# Altium schematic sheet STM32.SchDoc
size A4; SheetNumber: 8; SheetTotal: 9
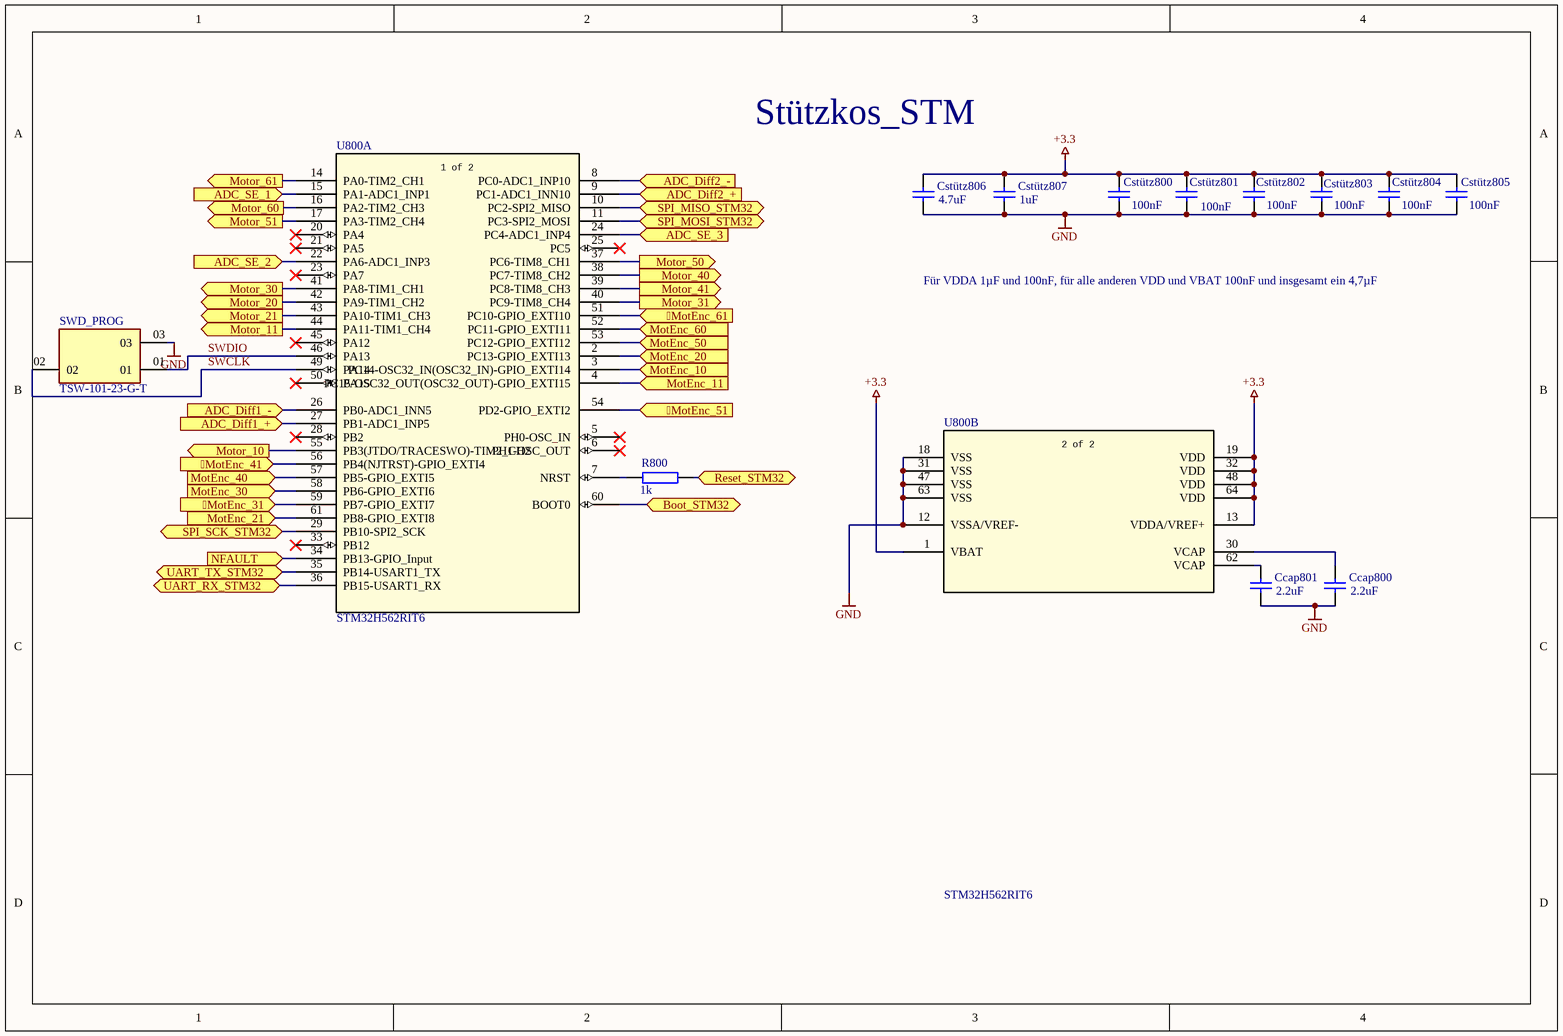
[diagram p0: STM32.SchDoc]

## Parts
Ccap800  value 2.2uF  [0603]  (hidden comment: 0603)
Ccap801  value 2.2uF  [0603]  (hidden comment: 0603)
Cstütz800  value 100nF  [0603]  (hidden comment: 0603)
Cstütz801  value 100nF  [0603]  (hidden comment: 0603)
Cstütz802  value 100nF  [0603]  (hidden comment: 0603)
Cstütz803  value 100nF  [0603]  (hidden comment: 0603)
Cstütz804  value 100nF  [0603]  (hidden comment: 0603)
Cstütz805  value 100nF  [0603]  (hidden comment: 0603)
Cstütz806  value 4.7uF  [0603]  (hidden comment: 0603)
Cstütz807  value 1uF  [0603]  (hidden comment: 0603)
R800  value 1k  [0603]  (hidden comment: 0603)
SWD_PROG  TSW-101-23-G-T  [SAMTEC_TSW-101-23-G-T]
U800  STM32H562RIT6  [LQFP64-10x10mm_STM]  (parts A,B of 2)

## Ports
MotEnc_31 (in, see DRV+Motor[3D]), MotEnc_41 (in, see DRV+Motor[3B]), MotEnc_51 (in, see DRV+Motor[3C]), MotEnc_61 (in, see DRV+Motor[3D]), ADC_Diff1_+ (in, see Test_Sensor_Connectoren[1A]), ADC_Diff1_- (in, see Test_Sensor_Connectoren[1A]), ADC_Diff2_+ (in, see Test_Sensor_Connectoren[1B]), ADC_Diff2_- (in, see Test_Sensor_Connectoren[1B]), ADC_SE_1 (in, see Test_Sensor_Connectoren[1C]), ADC_SE_2 (in, see Test_Sensor_Connectoren[1C]), ADC_SE_3 (in, see Test_Sensor_Connectoren[1D]), Boot_STM32 (bidir, see Raspberry_PI5[3B]), MotEnc_10 (in, see DRV+Motor[2B]), MotEnc_11 (in, see DRV+Motor[3B]), MotEnc_20 (in, see DRV+Motor[2C]), MotEnc_21 (in, see DRV+Motor[3C]), MotEnc_30 (in, see DRV+Motor[2D]), MotEnc_40 (in, see DRV+Motor[3B]), MotEnc_50 (in, see DRV+Motor[3C]), MotEnc_60 (in, see DRV+Motor[3D]), Motor_10 (out, see DRV+Motor[1A]), Motor_11 (out, see DRV+Motor[1A]), Motor_20 (out, see DRV+Motor[1A]), Motor_21 (out, see DRV+Motor[1A]), Motor_30 (out, see DRV+Motor[1B]), Motor_31 (out, see DRV+Motor[1B]), Motor_40 (out, see DRV+Motor[1C]), Motor_41 (out, see DRV+Motor[1C]), Motor_50 (out, see DRV+Motor[1D]), Motor_51 (out, see DRV+Motor[1D]), Motor_60 (out, see DRV+Motor[1D]), Motor_61 (out, see DRV+Motor[1D]), NFAULT (in, see DRV+Motor[2A], DRV+Motor[2B], DRV+Motor[2D], DRV+Motor[4A]), Reset_STM32 (bidir, see Raspberry_PI5[3B]), SPI_MISO_STM32 (bidir, see Raspberry_PI5[2B]), SPI_MOSI_STM32 (bidir, see Raspberry_PI5[2B]), SPI_SCK_STM32 (bidir, see Raspberry_PI5[2B]), UART_RX_STM32 (bidir, see Raspberry_PI5[3B]), UART_TX_STM32 (bidir, see Raspberry_PI5[3B])

## Nets
+3.3: Cstütz800.2 Cstütz801.2 Cstütz802.2 Cstütz803.2 Cstütz804.2 Cstütz805.2 Cstütz806.2 Cstütz807.2 U800.1(VBAT) U800.13(VDDA/VREF+) U800.19(VDD) U800.32(VDD) U800.48(VDD) U800.64(VDD)
GND: Ccap800.1 Ccap801.1 Cstütz800.1 Cstütz801.1 Cstütz802.1 Cstütz803.1 Cstütz804.1 Cstütz805.1 Cstütz806.1 Cstütz807.1 SWD_PROG.03 U800.12(VSSA/VREF-) U800.18(VSS) U800.31(VSS) U800.47(VSS) U800.63(VSS)
MotEnc_31: U800.59(PB7-GPIO_EXTI7) ; port MotEnc_31
MotEnc_41: U800.56(PB4(NJTRST)-GPIO_EXTI4) ; port MotEnc_41
MotEnc_51: U800.54(PD2-GPIO_EXTI2) ; port MotEnc_51
MotEnc_61: U800.51(PC10-GPIO_EXTI10) ; port MotEnc_61
ADC_Diff1_+: U800.27(PB1-ADC1_INP5) ; port ADC_Diff1_+
ADC_Diff1_-: U800.26(PB0-ADC1_INN5) ; port ADC_Diff1_-
ADC_Diff2_+: U800.9(PC1-ADC1_INN10) ; port ADC_Diff2_+
ADC_Diff2_-: U800.8(PC0-ADC1_INP10) ; port ADC_Diff2_-
ADC_SE_1: U800.15(PA1-ADC1_INP1) ; port ADC_SE_1
ADC_SE_2: U800.22(PA6-ADC1_INP3) ; port ADC_SE_2
ADC_SE_3: U800.24(PC4-ADC1_INP4) ; port ADC_SE_3
Boot_STM32: U800.60(BOOT0) ; port Boot_STM32
MotEnc_10: U800.3(PC14-OSC32_IN(OSC32_IN)-GPIO_EXTI14) ; port MotEnc_10
MotEnc_11: U800.4(PC15-OSC32_OUT(OSC32_OUT)-GPIO_EXTI15) ; port MotEnc_11
MotEnc_20: U800.2(PC13-GPIO_EXTI13) ; port MotEnc_20
MotEnc_21: U800.61(PB8-GPIO_EXTI8) ; port MotEnc_21
MotEnc_30: U800.58(PB6-GPIO_EXTI6) ; port MotEnc_30
MotEnc_40: U800.57(PB5-GPIO_EXTI5) ; port MotEnc_40
MotEnc_50: U800.53(PC12-GPIO_EXTI12) ; port MotEnc_50
MotEnc_60: U800.52(PC11-GPIO_EXTI11) ; port MotEnc_60
Motor_10: U800.55(PB3(JTDO/TRACESWO)-TIM2_CH2) ; port Motor_10
Motor_11: U800.44(PA11-TIM1_CH4) ; port Motor_11
Motor_20: U800.42(PA9-TIM1_CH2) ; port Motor_20
Motor_21: U800.43(PA10-TIM1_CH3) ; port Motor_21
Motor_30: U800.41(PA8-TIM1_CH1) ; port Motor_30
Motor_31: U800.40(PC9-TIM8_CH4) ; port Motor_31
Motor_40: U800.38(PC7-TIM8_CH2) ; port Motor_40
Motor_41: U800.39(PC8-TIM8_CH3) ; port Motor_41
Motor_50: U800.37(PC6-TIM8_CH1) ; port Motor_50
Motor_51: U800.17(PA3-TIM2_CH4) ; port Motor_51
Motor_60: U800.16(PA2-TIM2_CH3) ; port Motor_60
Motor_61: U800.14(PA0-TIM2_CH1) ; port Motor_61
NFAULT: U800.34(PB13-GPIO_Input) ; port NFAULT
Reset_STM32: R800.1 ; port Reset_STM32
SPI_MISO_STM32: U800.10(PC2-SPI2_MISO) ; port SPI_MISO_STM32
SPI_MOSI_STM32: U800.11(PC3-SPI2_MOSI) ; port SPI_MOSI_STM32
SPI_SCK_STM32: U800.29(PB10-SPI2_SCK) ; port SPI_SCK_STM32
SWCLK: SWD_PROG.02 U800.49(PA14)
SWDIO: SWD_PROG.01 U800.46(PA13)
UART_RX_STM32: U800.36(PB15-USART1_RX) ; port UART_RX_STM32
UART_TX_STM32: U800.35(PB14-USART1_TX) ; port UART_TX_STM32
NetCcap800_2: Ccap800.2 U800.30(VCAP)
NetCcap801_2: Ccap801.2 U800.62(VCAP)
NetR800_2: R800.2 U800.7(NRST)

Not connected (* = marked no-connect by the designer): U800 5(PH0-OSC_IN)* 6(PH1-OSC_OUT)* 20(PA4)* 21(PA5)* 23(PA7)* 25(PC5)* 28(PB2)* 33(PB12)* 45(PA12)* 50(PA15)*

## Notes on the sheet
- Stützkos_STM
- Für VDDA 1µF und 100nF, für alle anderen VDD und VBAT 100nF und insgesamt ein 4,7µF
- (in symbol STM32H562RIT6, part A) 1 of 2
- (in symbol STM32H562RIT6, part B) 2 of 2

## Library data of the parts
Ccap800 Ccap801 Cstütz800-Cstütz807 = KO: Kondensator
R800 = RES: Widerstand
U800 = STM32H562RIT6: High-performance, Arm Cortex-M33 with TrustZone, MCU with 2-Mbyte Flash, 640-Kbyte RAM, 250 MHz CPU; Manufacturer_Name: STMicroelectronics; Copyright: Copyright (C) 2025 Ultra Librarian. All rights reserved.; Manufacturer_Part_Number: STM32H562RIT6; Datasheet: https://www.st.com/resource/en/datasheet/stm32h562ag.pdf; RefDes: RefDes; Type: Type
SWD_PROG = TSW-101-23-G-T: Package: None; Price: None; Value: *; MP: TSW-101-23-G-T; Availability: Unavailable